# EasyEDA Pro project jackt-tong-yong-xiao-che-kong-zhi-qi-zhuan-li-948f377a.epro, board v5.2PCB
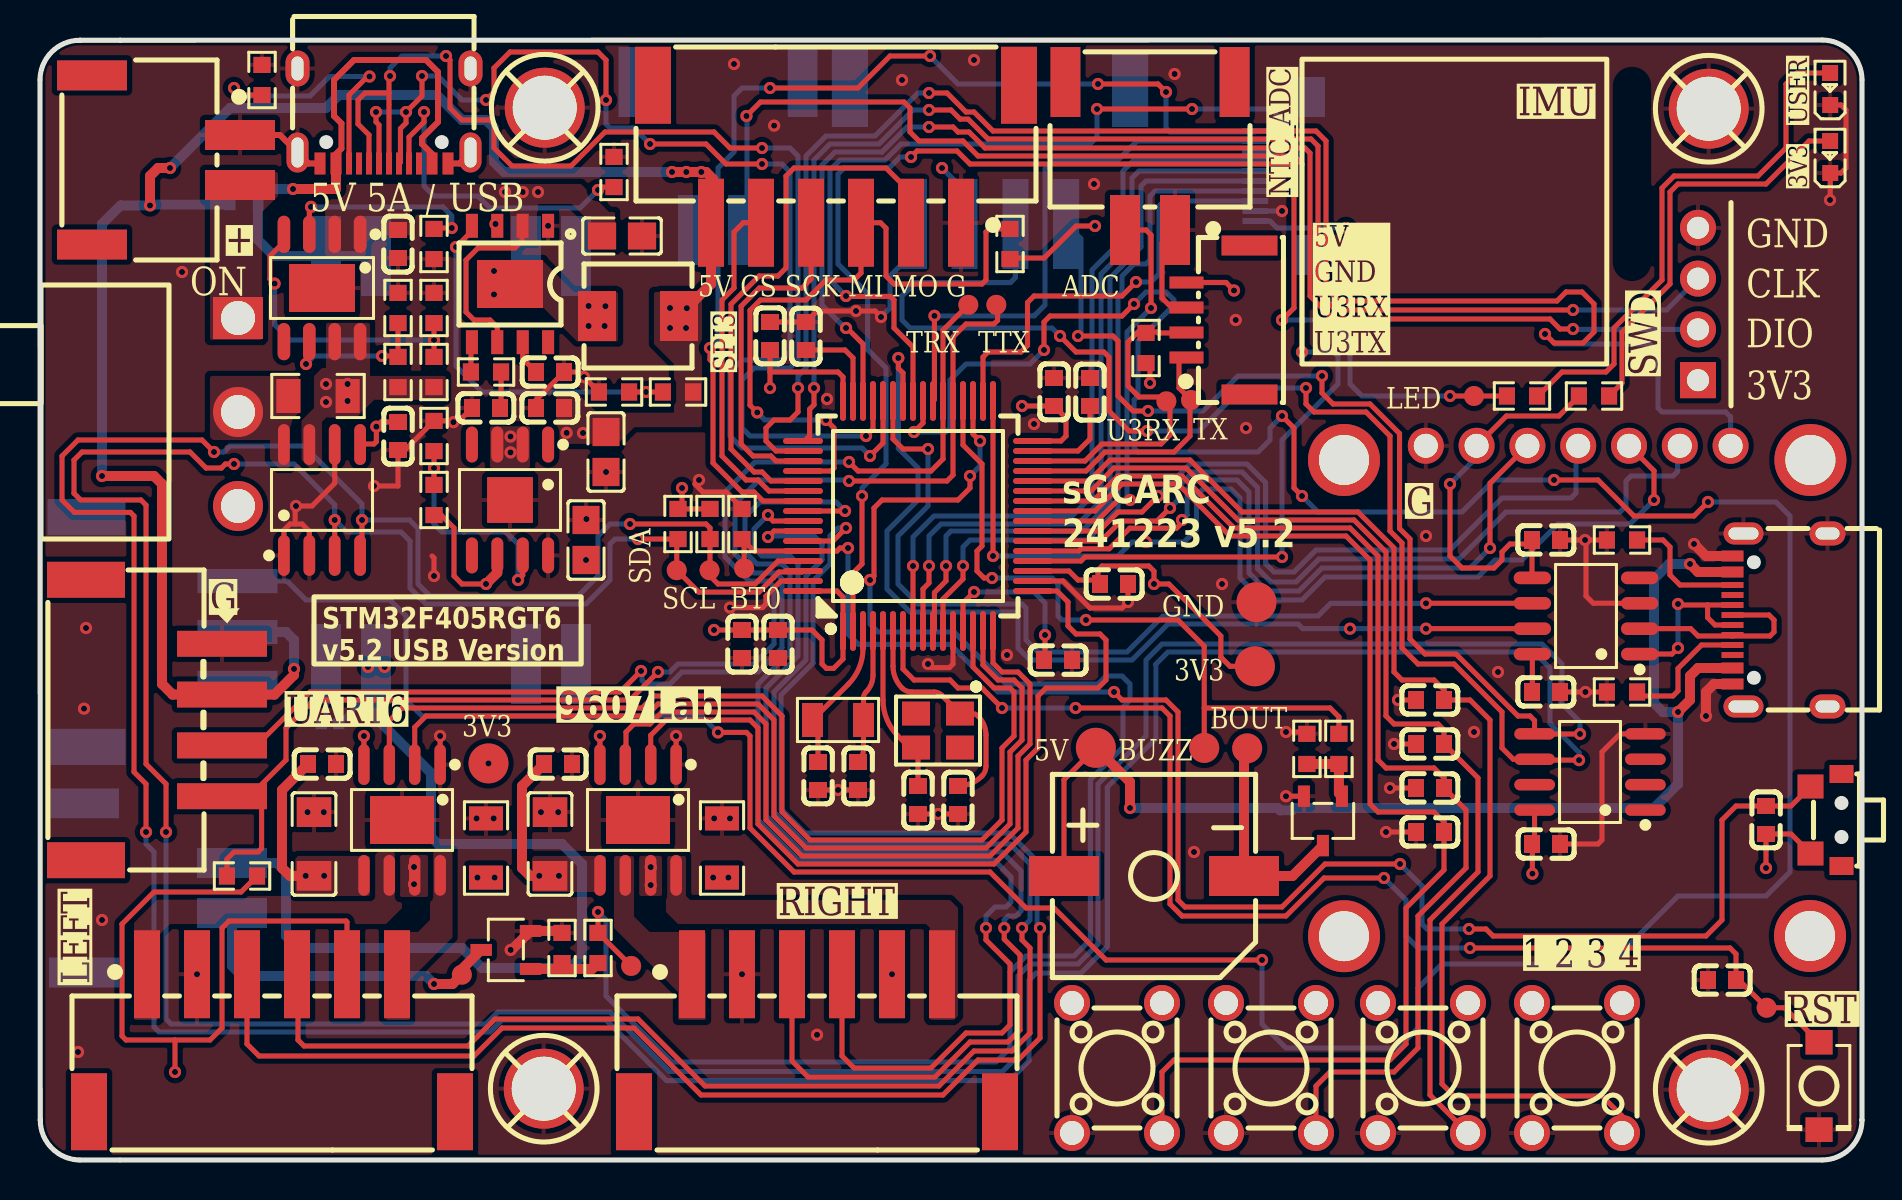
[diagram p6: board, top side]
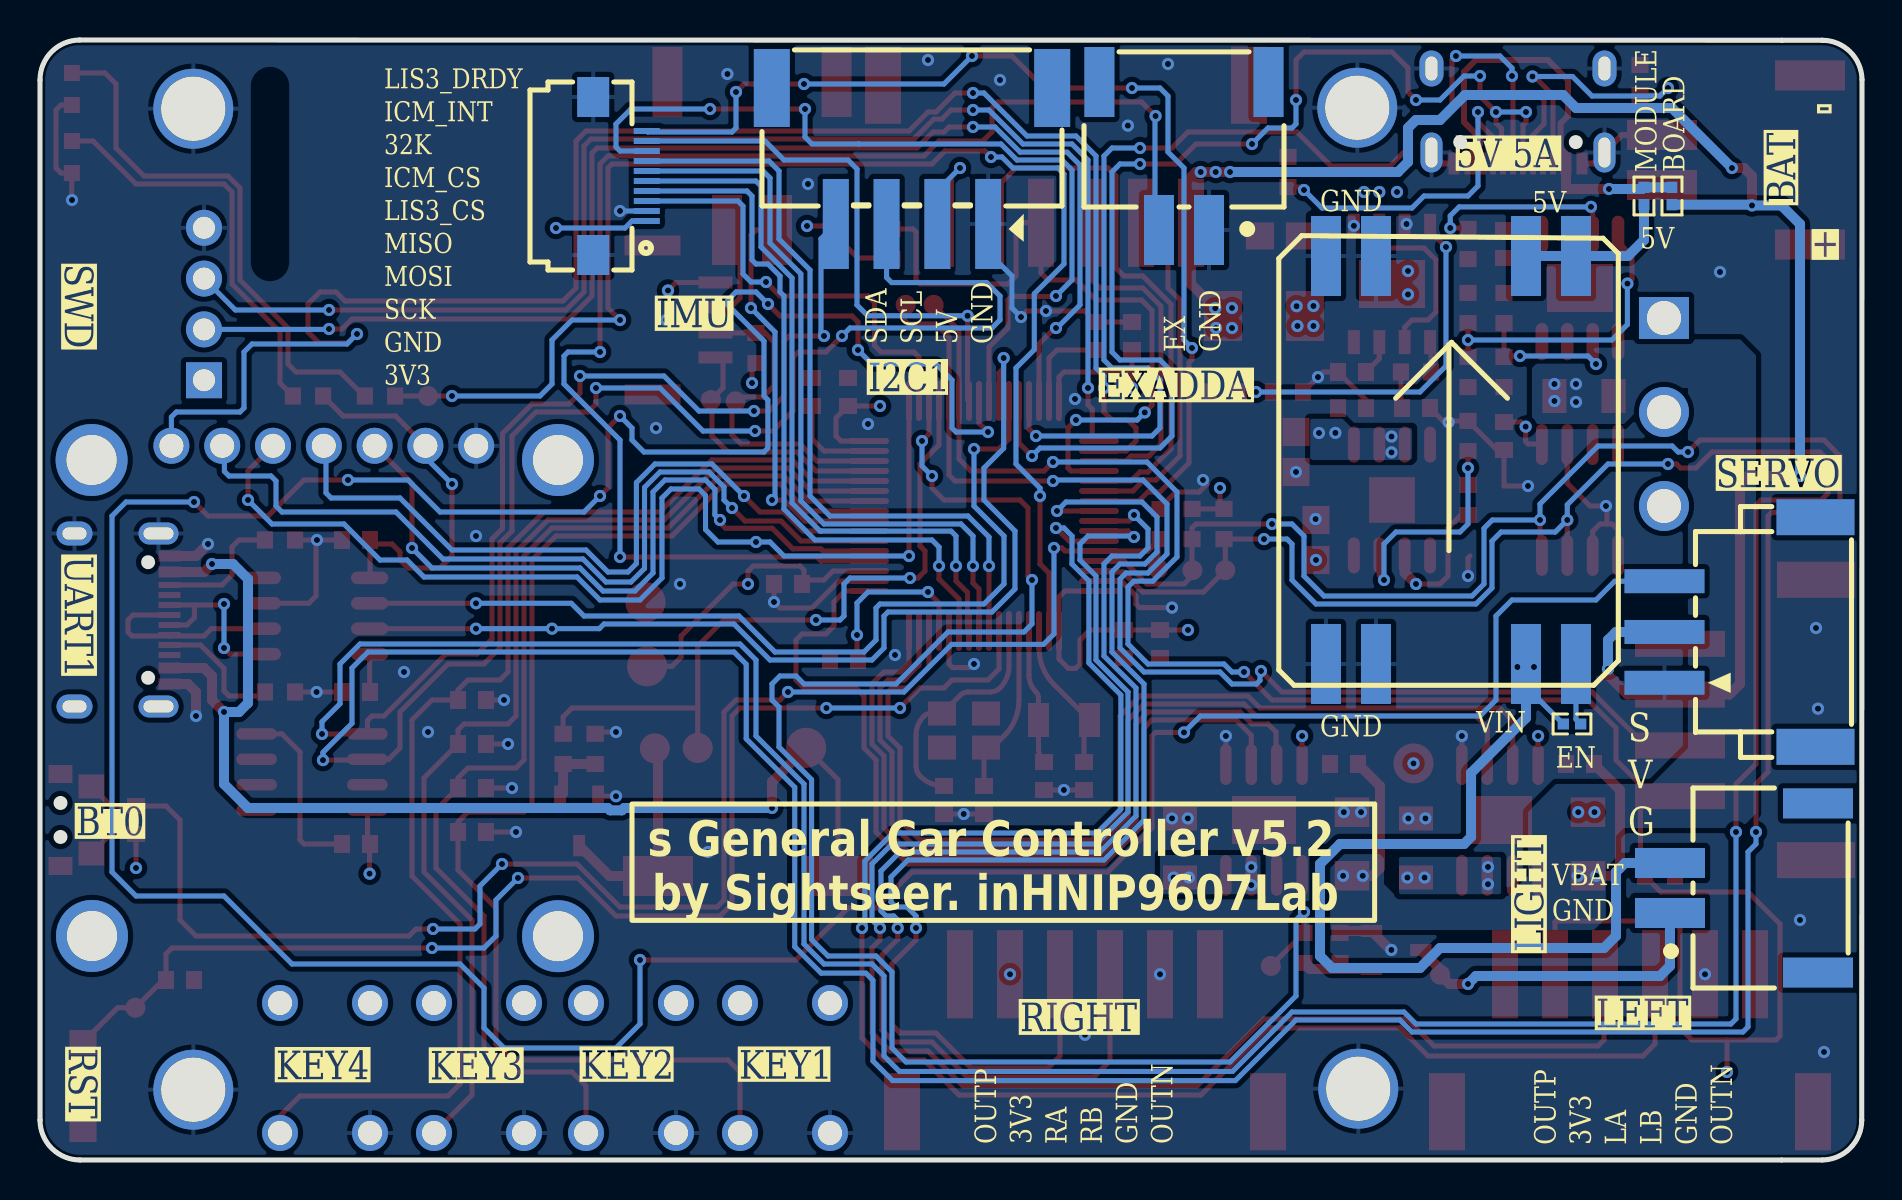
[diagram p7: board, bottom side, seen from below]

Outline 91.1 x 56 mm; copper layers: Top Layer, GND, VCC, Bottom Layer. Coordinates in mm from the lower left corner of the outline.
Outline path: 91.1,2 91.1,2 91.1,54 arc(90.52,55.41) 89.12,56 4,55.99 2,55.99 arc(0.59,55.41) 0,54.01 0.01,2 arc(0.59,0.59) 1.99,0 4.01,0 89.1,0 arc(90.51,0.58) 91.1,1.98
Stack: Top Layer 0.035mm 外层铜厚1oz / Dielectric1 0.2104mm 7628 RC49% 8.6mil / GND 0.0152mm 内层铜厚 / Dielectric2 1.065mm 1.1mm H/HOZ Copper / VCC 0.0152mm 内层铜厚 / Dielectric3 0.2104mm 7628 RC49% 8.6mil / Bottom Layer 0.035mm 外层铜厚1oz

## Design rules (mm)
spacing copperThickness1oz (default): track to track 0.102, other pairs 0.152 to 0.3
spacing copperThickness2oz: track to track 0.203, other pairs 0.152 to 0.3
spacing Plane_innerPlane: track to track 0.102, other pairs 0.152 to 0.3
spacing Copper_copperRegion: track to track 0.102, other pairs 0.152 to 0.3
spacing Copper_FULL: track to track 0.102, other pairs 0.152 to 0.3
track width copperThickness1oz (default): min 0.127, default 0.254, max 2.54
track width copperThickness2oz: min 0.203, default 0.254, max 2.54
differential pair differentialPair (default): width min 0.127, default 0.254, max 2.54; gap min 0.152, default 0.152
net 5V uses FULL
net VM uses FULL
net VBAT uses FULL
net $1N904 uses FULL
net ML_OUTN uses FULL
net ML_OUTP uses FULL
net MR_OUTN uses FULL
net MR_OUTP uses FULL
net $2N4785 uses FULL
net $1N1481 uses FULL
net $1N949 uses FULL
net $1N2370 uses FULL
net $1N2361 uses FULL
region e1 uses Copper_copperRegion, copperRegion_Copper_copperRegion
region e2 uses Copper_copperRegion, copperRegion_Copper_copperRegion
region e3 uses Copper_copperRegion, copperRegion_Copper_copperRegion
region e4 uses Copper_copperRegion, copperRegion_Copper_copperRegion
region e5 uses Copper_copperRegion, copperRegion_Copper_copperRegion
region e6 uses Copper_copperRegion, copperRegion_Copper_copperRegion
region e7 uses Copper_copperRegion, copperRegion_Copper_copperRegion
region e8 uses Copper_copperRegion, copperRegion_Copper_copperRegion
region e9 uses Copper_copperRegion, copperRegion_Copper_copperRegion
region e10 uses Copper_copperRegion, copperRegion_Copper_copperRegion
region e11 uses Copper_copperRegion, copperRegion_Copper_copperRegion
region e12 uses Copper_copperRegion, copperRegion_Copper_copperRegion
region e13 uses Copper_copperRegion, copperRegion_Copper_copperRegion
region e14 uses Copper_copperRegion, copperRegion_Copper_copperRegion
region e15 uses Copper_copperRegion, copperRegion_Copper_copperRegion
region e16 uses Copper_copperRegion, copperRegion_Copper_copperRegion
region e17 uses Copper_copperRegion, copperRegion_Copper_copperRegion
region e18 uses Copper_copperRegion, copperRegion_Copper_copperRegion
region e19 uses Copper_copperRegion, copperRegion_Copper_copperRegion
region e20 uses Copper_copperRegion, copperRegion_Copper_copperRegion
region e21 uses Copper_copperRegion, copperRegion_Copper_copperRegion
region e22 uses Copper_copperRegion, copperRegion_Copper_copperRegion
region e23 uses Copper_copperRegion, copperRegion_Copper_copperRegion
region e24 uses Copper_copperRegion, copperRegion_Copper_copperRegion
region e25 uses Copper_copperRegion, copperRegion_Copper_copperRegion
region e26 uses Copper_copperRegion, copperRegion_Copper_copperRegion
region e27 uses Copper_copperRegion, copperRegion_Copper_copperRegion
region e28 uses Copper_copperRegion, copperRegion_Copper_copperRegion
region e29 uses Copper_copperRegion, copperRegion_Copper_copperRegion
region e30 uses Copper_copperRegion, copperRegion_Copper_copperRegion
region e31 uses Copper_copperRegion, copperRegion_Copper_copperRegion
region e32 uses Copper_copperRegion, copperRegion_Copper_copperRegion
region e33 uses Copper_copperRegion, copperRegion_Copper_copperRegion
region e34 uses Copper_copperRegion, copperRegion_Copper_copperRegion
region e35 uses Copper_copperRegion, copperRegion_Copper_copperRegion
region e36 uses Copper_copperRegion, copperRegion_Copper_copperRegion
region e37 uses Copper_copperRegion, copperRegion_Copper_copperRegion
region e38 uses Copper_copperRegion, copperRegion_Copper_copperRegion
region e39 uses Copper_copperRegion, copperRegion_Copper_copperRegion
region e40 uses Copper_copperRegion, copperRegion_Copper_copperRegion
region e41 uses Copper_copperRegion, copperRegion_Copper_copperRegion
region e42 uses Copper_copperRegion, copperRegion_Copper_copperRegion
region e43 uses Copper_copperRegion, copperRegion_Copper_copperRegion
region e44 uses Copper_copperRegion, copperRegion_Copper_copperRegion
region e45 uses Copper_copperRegion, copperRegion_Copper_copperRegion
region e46 uses Copper_copperRegion, copperRegion_Copper_copperRegion
region e47 uses Copper_copperRegion, copperRegion_Copper_copperRegion
region e48 uses Copper_copperRegion, copperRegion_Copper_copperRegion
region e49 uses Copper_copperRegion, copperRegion_Copper_copperRegion
region e50 uses Copper_copperRegion, copperRegion_Copper_copperRegion
region e51 uses Copper_copperRegion, copperRegion_Copper_copperRegion
region e52 uses Copper_copperRegion, copperRegion_Copper_copperRegion
region e53 uses Copper_copperRegion, copperRegion_Copper_copperRegion
region e54 uses Copper_copperRegion, copperRegion_Copper_copperRegion
region e55 uses Copper_copperRegion, copperRegion_Copper_copperRegion
region e56 uses Copper_copperRegion, copperRegion_Copper_copperRegion
region e57 uses Copper_copperRegion, copperRegion_Copper_copperRegion
region e58 uses Copper_copperRegion, copperRegion_Copper_copperRegion
region e59 uses Copper_copperRegion, copperRegion_Copper_copperRegion
region e60 uses Copper_FULL, copperRegion_Copper_FULL
region e61 uses Copper_FULL, copperRegion_Copper_FULL
region e62 uses Copper_copperRegion, copperRegion_Copper_copperRegion
region e63 uses Copper_copperRegion, copperRegion_Copper_copperRegion
region e64 uses Copper_copperRegion, copperRegion_Copper_copperRegion
region e65 uses Copper_copperRegion, copperRegion_Copper_copperRegion
region e66 uses Copper_copperRegion, copperRegion_Copper_copperRegion
region e67 uses Copper_copperRegion, copperRegion_Copper_copperRegion
region e68 uses Copper_copperRegion, copperRegion_Copper_copperRegion
region e69 uses Copper_copperRegion, copperRegion_Copper_copperRegion
pour e2056 uses Copper_FULL, copperRegion_Copper_FULL
pour e2058 uses Copper_FULL, copperRegion_Copper_FULL
pour e2060 uses Copper_FULL, copperRegion_Copper_FULL
pour e2062 uses Copper_FULL, copperRegion_Copper_FULL
pour e2064 uses Copper_FULL, copperRegion_Copper_FULL
pour e2066 uses Copper_FULL, copperRegion_Copper_FULL
pour e2068 uses Copper_FULL, copperRegion_Copper_FULL
pour e2070 uses Copper_FULL, copperRegion_Copper_FULL
pour e2072 uses Copper_FULL, copperRegion_Copper_FULL
pour e2074 uses Copper_FULL, copperRegion_Copper_FULL
pour e2076 uses Copper_FULL, copperRegion_Copper_FULL
pour e2078 uses Copper_FULL, copperRegion_Copper_FULL
pour e2080 uses Copper_FULL, copperRegion_Copper_FULL
pour e2082 uses Copper_FULL, copperRegion_Copper_FULL
pour e2084 uses Copper_FULL, copperRegion_Copper_FULL
pour e2086 uses Copper_FULL, copperRegion_Copper_FULL
pour e2088 uses Copper_FULL, copperRegion_Copper_FULL
pour e2090 uses Copper_FULL, copperRegion_Copper_FULL
pour e2092 uses Copper_copperRegion, copperRegion_Copper_copperRegion
pour e2367 uses Copper_copperRegion, copperRegion_Copper_copperRegion
pour e2474 uses Copper_FULL, copperRegion_Copper_FULL

## Placement (name value [footprint] x y rotation side)
BUZZER1  2.7kHz  [BUZ-SMD_L9.6-W9.6-LS10.0-R]  55.7 14.2 180 top
C1  0.1uF  [C0603]  17.9 36.2 90 top
C3  0.1uF  [C0603]  17.9 45.8 90 top
C4  10uF  [C0805]  29.1 46.2 180 top
C6  16nF  [C0603]  22.3 37.6 0 top
C7  22nF  [C0603]  25.5 39.4 180 top
C8  0.1uF  [C0603]  25.5 37.6 0 top
C9  22uF  [C0805]  28.3 35.4 90 top
C10  0.1uF  [C0603]  14.1 19.8 180 top
C11  22uF  [C1206]  13.7 15.8 270 top
C12  22uF  [C0805]  27.3 31 270 top
C13  0.1uF  [C0603]  25.9 19.8 180 top
C14  22uF  [C1206]  25.5 15.8 270 top
C16  0.1uF  [C0603]  75.3 23.4 0 top
C17  0.1uF  [C0603]  75.3 31 0 top
C20  0.1uF  [C0603]  75.3 15.8 180 top
C21  0.1uF  [C0603]  50.9 25 180 top
C22  0.1uF  [C0603]  53.7 28.8 180 top
C23  0.1uF  [C0603]  36.5 41.2 270 top
C24  0.1uF  [C0603]  36.9 25.8 90 top
C25  0.1uF  [C0603]  50.7 38.4 270 top
C26  0.1uF  [C0603]  69.5 16.4 0 top
C27  0.1uF  [C0603]  69.5 18.6 0 top
C28  0.1uF  [C0603]  69.5 20.8 0 top
C29  0.1uF  [C0603]  69.5 23 0 top
C30  0.1uF  [C0603]  86.3 17 270 top
C31  2.2uF  [C0603]  52.5 38.4 90 top
C32  1uF  [C0603]  35.1 25.8 90 top
C33  2.2uF  [C0603]  38.3 41.2 90 top
C34  0.1uF  [C0603]  84.1 9 180 top
C35  22pF  [C0603]  43.9 18 90 top
C36  22pF  [C0603]  38.9 19.2 270 top
C37  22pF  [C0603]  45.9 18 90 top
C38  22pF  [C0603]  40.9 19.2 270 top
CN1  ZX-XH2.54-2PWT  [CONN-SMD_2P-P2.54_MEGASTAR_ZX-XH2.54-2PWT]  6.3 50 270 top
CN2  HCZZ0021-6  [CONN-SMD_HCZZ0021-6]  11.6 5.85 0 top
CN3  HCZZ0021-6  [CONN-SMD_HCZZ0021-6]  38.85 5.85 0 top
CN5  ZX-XH2.54-2PWT  [CONN-SMD_2P-P2.54_MEGASTAR_ZX-XH2.54-2PWT]  5.9 13.6 90 bottom
CN6  HCZZ0021-6  [CONN-SMD_HCZZ0021-6]  39.8 50.3 180 top
CN7  XDWF-2500-04P  [CONN-SMD_4P-P2.54_MXXH-2.54-04P-WT1-0-A]  5.7 22 270 top
CN9  ZX-XH2.54-2PWT  [CONN-SMD_2P-P2.54_MEGASTAR_ZX-XH2.54-2PWT]  55.5 50.2 180 top
CN10  ZX-XH2.54-2PWT  [CONN-SMD_2P-P2.54_MEGASTAR_ZX-XH2.54-2PWT]  33.9 50.2 0 bottom
CN11  XDWF-2500-04P  [CONN-SMD_4P-P2.54_MXXH-2.54-04P-WT1-0-A]  47.5 50.2 0 bottom
CN12  ZX-XH2.54-3PWT  [CONN-SMD_3P-P2.54-XH2.54-WT]  6.1 26.4 90 bottom
CRYSTAL1  8MHz  [CRYSTAL-SMD_4P-L3.2-W2.5-BL_SIT8008BI]  44.9 21.47 180 top
FPC1  AFC01-S10FCA-00  [FPC-SMD_P0.5-10P_FGS-XJ-H2.0]  62.1 49.2 90 bottom
H3  PZ254R-11-04P  [HDR-TH_4P-P2.54-H-M-W10.4]  82.9 42.8 90 top
L1  4.7uH  [IND-SMD_L5.4-W5.2_FXL0530]  29.9 42.2 0 top
LED1  -  [LED_0603]  89.5 50.2 90 top
LED2  -  [LED_0603]  89.5 53.6 90 top
Q1  AO3400A  [SOT-23-3_L2.9-W1.6-P1.90-LS2.8-BR]  23.29 10.5 0 top
Q2  AO3400A  [SOT-23-3_L2.9-W1.6-P1.90-LS2.8-BR]  64.15 16.96 90 top
R1  50mR  [R1206]  13.9 38.2 0 top
R2  52.5K  [R0603]  31.9 38.4 0 top
R3  1.4K  [R0603]  22.3 39.4 180 top
R4  10K  [R0603]  28.7 38.4 0 top
R5  22K  [R0603]  19.7 33 270 top
R6  100mR  [R1206]  22.3 15.6 90 top
R7  3.92K  [R0603]  19.7 36.2 270 top
R8  100mR  [R1206]  34.1 15.6 90 top
R9  0  [R0402]  14.5 21.8 180 bottom
R12  5.1K  [R0603]  79.1 31 0 top
R17  5.1K  [R0603]  79.1 23.4 0 top
R18  510R  [R0603]  27.9 10.6 270 top
R19  100K  [R0603]  26.1 10.6 270 top
R20  4.7K  [R0603]  48.5 45.8 270 top
R21  4.7K  [R0603]  10.1 14.2 0 top
R22  2.2K  [R0603]  31.9 31.8 90 top
R23  2.2K  [R0603]  33.5 31.8 90 top
R24  220R  [R0603]  64.95 20.56 270 top
R25  100K  [R0603]  63.35 20.56 270 top
R26  470R  [R0603]  77.7 38.2 180 top
R27  220R  [R0603]  74.1 38.2 180 top
R28  10K  [R0603]  35.1 31.8 270 top
R29  150K  [R0603]  19.7 39.4 90 top
R30  10K  [R0603]  19.7 42.6 90 top
R31  4.7K  [R0603]  19.7 45.8 90 top
R32  47K  [R0603]  17.9 39.4 270 top
R33  10K  [R0603]  17.9 42.6 270 top
R35  4.7K  [R0603]  55.3 40.6 90 top
R36  NC  [R0402]  10.9 48.2 90 bottom
R37  NC  [R0402]  9.5 48.2 90 bottom
R38  5.1K  [R0603]  11.1 54 270 top
R39  5.1K  [R0603]  28.7 49.4 270 top
SCREW1  -  [M3螺丝]  25.3 52.55 0 top
SCREW2  -  [M3螺丝]  83.5 52.5 0 top
SCREW3  -  [M3螺丝]  25.25 3.5 0 top
SCREW4  -  [M3螺丝]  83.5 3.45 0 top
SW1  -  [SW-TH_4P-L6.0-W6.0-P4.50-LS6.5]  53.85 4.6 90 top
SW2  -  [SW-TH_4P-L6.0-W6.0-P4.50-LS6.5]  61.55 4.6 90 top
SW3  -  [SW-TH_4P-L6.0-W6.0-P4.50-LS6.5]  69.15 4.6 90 top
SW4  -  [SW-TH_4P-L6.0-W6.0-P4.50-LS6.5]  76.85 4.6 90 top
SW5  TS24CA  [SW-SMD_TS24CA]  89.3 17 270 top
SW6  TS-1088-AR02016  [SW-SMD_L3.9-W3.0-P4.45]  88.95 3.7 270 top
TP1  -  [Test-Point-0.5mm]  52.79 20.61 0 top
TP2  -  [Test-Point-0.5mm]  60.75 24.69 0 top
TP5  -  [Test-Point-0.5mm#2]  57.55 38 0 top
TP6  -  [Test-Point-0.5mm#2]  56.32 37.94 0 top
TP7  -  [Test-Point-0.5mm#2]  21.09 9.27 0 top
TP8  -  [Test-Point-0.5mm#2]  29.56 9.7 0 top
TP10  -  [Test-Point-0.5mm#2]  46.42 42.76 0 top
TP11  -  [Test-Point-0.5mm#2]  47.82 42.76 0 top
TP13  -  [Test-Point-0.5mm#3]  60.36 20.58 0 top
TP14  -  [Test-Point-0.5mm#3]  58.21 20.6 0 top
TP15  -  [Test-Point-0.5mm#2]  31.84 29.49 0 top
TP16  -  [Test-Point-0.5mm#2]  33.48 29.49 0 top
TP17  -  [Test-Point-0.5mm]  22.42 19.83 0 top
TP19  -  [Test-Point-0.5mm#2]  71.7 38.2 0 top
TP20  -  [Test-Point-0.5mm]  60.82 27.89 0 top
TP21  -  [Test-Point-0.5mm#2]  35.21 29.58 0 top
TP22  -  [Test-Point-0.5mm#2]  86.33 7.61 0 top
U1  SS-12D06-G050  [SW-TH_3P-P4.70_SS-12D06-G050]  9.9 37.4 270 top
U2  INA219AID  [SOIC-8_L4.9-W3.9-P1.27-LS6.0-BL]  14.1 33 0 top
U3  MX25947ES  [ESOP-8_L4.9-W3.9-P1.27-LS6.0-BL-EP-1]  14.1 43.6 180 top
U4  ME3118ASPG  [ESOP-8_L4.9-W3.9-P1.27-LS6.0-BL-EP]  23.5 43.8 180 top
U5  RT2515HGSP  [SOP-8_L4.9-W3.9-P1.27-LS6.0-BL-EP]  23.5 33 180 top
U6  DRV8870DDAR  [HSOP-8_L5.0-W4.0-P1.27-LS6.2-BL-EP]  18.1 17 180 top
U7  DRV8870DDAR  [HSOP-8_L5.0-W4.0-P1.27-LS6.2-BL-EP]  29.9 17 180 top
U8  XN-50L  [小聂studio-5V稳压]  14.3 45.2 270 bottom
U9  CH340N  [SOP-8_L4.9-W3.9-P1.27-LS6.0-BL]  77.3 27.2 90 top
U11  WAFER-GH1.25-4PWB  [CONN-SMD_4P-P1.25_XUNPU_WAFER-GH1.25-4PWB]  58.9 42 90 top
U13  -  [0.96寸7针OLED]  63.2 9 0 top
U14  STM32F405RGT6  [LQFP-64_L10.0-W10.0-P0.50-LS12.0-BL]  43.9 32.2 0 top
U15  MB85RC64TAPNF-G-BDERE1  [SOP-8_L5.0-W4.0-P1.27-LS6.0-BL]  77.5 19.4 90 top
USB1  TYPE-C 16PIN 2MD(073)  [USB-C-SMD_TYPE-C-6PIN-2MD-073]  87 27 90 top
USB2  TYPE-C 16PIN 2MD(073)  [USB-C-SMD_TYPE-C-6PIN-2MD-073]  17.2 52.2 180 top
X1  32.768kHz  [OSC-SMD_L3.2-W1.5]  39.9 22 180 top

## Footprints (pads in the part's own frame, mm; a bottom-side part is the same pattern mirrored in y, then rotated)
0.96寸7针OLED
  round 3.6 hole 2.5: 0(2,26) 0(2,2.19) 0(25.3,2.2) 0(25.32,26)
  round 1.8 hole 1.2: 1(6.09,26.71) 2(8.63,26.71) 3(11.17,26.71) 4(13.71,26.71) 5(16.25,26.71) 6(18.79,26.71) 7(21.33,26.71)
BUZ-SMD_L9.6-W9.6-LS10.0-R
  rect 3.5x2 smd: 1(4.5,0) 2(-4.5,0)
C0603
  rect 0.8x0.9 smd: 1(-0.7,0) 2(0.7,0)
C0805
  rect 1.41x1.35 smd: 1(-1,0) 2(1,0)
C1206
  rect 1.485x1.728 smd: 1(-1.593,0) 2(1.593,0)
CONN-SMD_2P-P2.54_MEGASTAR_ZX-XH2.54-2PWT
  rect 1.5x3.5 smd: 1(-1.25,3.7) 2(1.25,3.7) 3(-4.23,-3.7) 4(4.23,-3.7)
CONN-SMD_3P-P2.54-XH2.54-WT
  rect 1.2x4 smd: 1(-2.54,3.775) 2(0,3.775) 3(2.54,3.775)
  rect 1.8x3.9 smd: 4(-5.74,-3.775) 5(5.74,-3.775)
CONN-SMD_4P-P1.25_XUNPU_WAFER-GH1.25-4PWB
  rect 0.6x1.7 smd: 1(-1.875,1.575) 2(-0.625,1.575) 3(0.625,1.575) 4(1.875,1.575)
  rect 1x2.8 smd: 5(3.725,-1.575) 6(-3.725,-1.575)
CONN-SMD_4P-P2.54_MXXH-2.54-04P-WT1-0-A
  rect 1.3x4.5 smd: 1(-3.809,3.4) 2(-1.27,3.4) 3(1.27,3.4) 4(3.81,3.4)
  rect 1.8x3.9 smd: 5(7.01,-3.4) 6(-7.01,-3.4)
CONN-SMD_HCZZ0021-6
  rect 1.3x4.4 smd: 1(-6.25,3.438) 2(-3.75,3.438) 3(-1.25,3.438) 4(1.25,3.438) 5(3.75,3.438) 6(6.25,3.438)
  rect 1.8x3.85 smd: 7(-9.15,-3.438) 8(9.15,-3.438)
CRYSTAL-SMD_4P-L3.2-W2.5-BL_SIT8008BI
  rect 1.4x1.2 smd: 1(-1.1,-0.85) 2(1.1,-0.85) 3(1.1,0.85) 4(-1.1,0.85)
ESOP-8_L4.9-W3.9-P1.27-LS6.0-BL-EP
  rect 0.6x1.2 smd: 1(-1.905,-2.909) 2(-0.635,-2.909) 3(0.635,-2.909) 4(1.905,-2.909) 5(1.905,2.909) 6(0.635,2.909) 7(-0.635,2.909) 8(-1.905,2.909)
  rect 3.3x2.4 smd: 9(0,0)
ESOP-8_L4.9-W3.9-P1.27-LS6.0-BL-EP-1
  oval 0.63x1.865 smd: 1(-1.905,-2.683) 2(-0.635,-2.683) 3(0.635,-2.683) 4(1.905,-2.683) 5(1.905,2.683) 6(0.635,2.683) 7(-0.635,2.683) 8(-1.905,2.683)
  rect 3.3x2.4 smd: 9(0,0)
FPC-SMD_P0.5-10P_FGS-XJ-H2.0
  rect 0.3x1.3 smd: 1(-2.25,-1.339) 2(-1.75,-1.339) 3(-1.25,-1.34) 4(-0.75,-1.339) 5(-0.25,-1.34) 6(0.25,-1.339) 7(0.75,-1.339) 8(1.25,-1.339) 9(1.75,-1.339) 10(2.25,-1.34)
  rect 2x1.6 smd: 11(3.95,1.34) 12(-3.95,1.34)
HDR-TH_4P-P2.54-H-M-W10.4
  rect 1.8x1.8 hole 1.1: 1(-3.81,0)
  round 1.8 hole 1.1: 2(-1.27,0) 3(1.27,0) 4(3.81,0)
HSOP-8_L5.0-W4.0-P1.27-LS6.2-BL-EP
  oval 0.574x2.038 smd: 1(-1.905,-2.769) 2(-0.635,-2.769) 3(0.635,-2.769) 4(1.905,-2.769) 5(1.905,2.769) 6(0.635,2.769) 7(-0.635,2.769) 8(-1.905,2.769)
  rect 3.2x2.4 smd: 9(0,0)
IND-SMD_L5.4-W5.2_FXL0530
  rect 1.9x2.5 smd: 1(-2.05,0) 2(2.05,0)
LED_0603
  rect 0.8x0.8 smd: 1(-0.851,-0.01) 2(0.75,-0.005)
LQFP-64_L10.0-W10.0-P0.50-LS12.0-BL
  oval 0.3x2 smd: 1(-3.75,-5.75) 2(-3.25,-5.75) 3(-2.75,-5.75) 4(-2.25,-5.75) 5(-1.75,-5.75) 6(-1.25,-5.75) 7(-0.75,-5.75) 8(-0.25,-5.75) 9(0.25,-5.75) 10(0.75,-5.75) 11(1.25,-5.75) 12(1.75,-5.75) 13(2.25,-5.75) 14(2.75,-5.75) 15(3.25,-5.75) 16(3.75,-5.75) 33(3.75,5.75) 34(3.25,5.75) 35(2.75,5.75) 36(2.25,5.75) 37(1.75,5.75) 38(1.25,5.75) 39(0.75,5.75) 40(0.25,5.75) 41(-0.25,5.75) 42(-0.75,5.75) 43(-1.25,5.75) 44(-1.75,5.75) 45(-2.25,5.75) 46(-2.75,5.75) 47(-3.25,5.75) 48(-3.75,5.75)
  oval 2x0.3 smd: 17(5.75,-3.75) 18(5.75,-3.25) 19(5.75,-2.75) 20(5.75,-2.25) 21(5.75,-1.75) 22(5.75,-1.25) 23(5.75,-0.75) 24(5.75,-0.25) 25(5.75,0.25) 26(5.75,0.75) 27(5.75,1.25) 28(5.75,1.75) 29(5.75,2.25) 30(5.75,2.75) 31(5.75,3.25) 32(5.75,3.75) 49(-5.75,3.75) 50(-5.75,3.25) 51(-5.75,2.75) 52(-5.75,2.25) 53(-5.75,1.75) 54(-5.75,1.25) 55(-5.75,0.75) 56(-5.75,0.25) 57(-5.75,-0.25) 58(-5.75,-0.75) 59(-5.75,-1.25) 60(-5.75,-1.75) 61(-5.75,-2.25) 62(-5.75,-2.75) 63(-5.75,-3.25) 64(-5.75,-3.75)
M3螺丝
  round 4 hole 3.2: 1(-0.064,0.064)
OSC-SMD_L3.2-W1.5
  rect 1.05x1.7 smd: 1(-1.275,0) 2(1.275,0)
R0402
  rect 0.566x0.54 smd: 1(-0.433,0) 2(0.433,0)
R0603
  rect 0.806x0.864 smd: 1(-0.753,0) 2(0.753,0)
R1206
  rect 1.208x1.701 smd: 1(-1.479,0) 2(1.479,0)
SOIC-8_L4.9-W3.9-P1.27-LS6.0-BL
  oval 0.588x2.045 smd: 1(-1.905,-2.772) 2(-0.635,-2.772) 3(0.635,-2.772) 4(1.905,-2.772) 5(1.905,2.772) 6(0.635,2.772) 7(-0.635,2.772) 8(-1.905,2.772)
SOP-8_L4.9-W3.9-P1.27-LS6.0-BL
  oval 0.63x1.865 smd: 1(-1.905,-2.683) 2(-0.635,-2.683) 3(0.635,-2.683) 4(1.905,-2.683) 5(1.905,2.683) 6(0.635,2.683) 7(-0.635,2.683) 8(-1.905,2.683)
SOP-8_L4.9-W3.9-P1.27-LS6.0-BL-EP
  oval 0.6x1.8 smd: 1(-1.905,-2.772) 2(-0.635,-2.772) 3(0.635,-2.772) 4(1.905,-2.772) 5(1.905,2.772) 6(0.635,2.772) 7(-0.635,2.772) 8(-1.905,2.772)
  rect 2.29x2.29 smd: 9(0,0)
SOP-8_L5.0-W4.0-P1.27-LS6.0-BL
  oval 0.574x2.035 smd: 1(-1.905,-2.768) 2(-0.635,-2.768) 3(0.635,-2.768) 4(1.905,-2.768) 5(1.905,2.768) 6(0.635,2.768) 7(-0.635,2.768) 8(-1.905,2.768)
SOT-23-3_L2.9-W1.6-P1.90-LS2.8-BR
  rect 1.07x0.6 smd: 1(1.235,-0.95) 2(1.235,0.95) 3(-1.235,0)
SW-SMD_L3.9-W3.0-P4.45
  rect 1.23x1.36 smd: 1(-2.185,0) 2(2.185,0)
SW-SMD_TS24CA
  rect 0.9x1.2 smd: 1(-2.3,0.775) 2(2.3,0.775)
  rect 1.2x1.3 smd: 3(-1.675,-0.775) 4(1.675,-0.775)
SW-TH_3P-P4.70_SS-12D06-G050
  rect 2.1x2.5 hole 1.7: 1(-4.7,0)
  round 2.5 hole 1.7: 2(0,0) 3(4.7,0)
SW-TH_4P-L6.0-W6.0-P4.50-LS6.5
  round 1.8 hole 1.2: 1(-3.25,2.25) 2(3.25,2.25) 3(-3.25,-2.25) 4(3.25,-2.25)
Test-Point-0.5mm
  round 2 smd: 1(0,0)
Test-Point-0.5mm#2
  round 1 smd: 1(0,0)
Test-Point-0.5mm#3
  round 1.5 smd: 1(0,0)
USB-C-SMD_TYPE-C-6PIN-2MD-073
  rect 0.55x1.1 smd: 1(-3.2,2.375) 2(-2.4,2.375) 11(2.4,2.375) 12(3.2,2.375)
  rect 0.3x1.1 smd: 3(-1.75,2.375) 4(-1.25,2.375) 5(-0.75,2.375) 6(-0.25,2.375) 7(0.25,2.375) 8(0.75,2.375) 9(1.25,2.375) 10(1.75,2.375)
  oval 1.1x2 hole 0.6x1.5: 13(-4.325,1.825) 14(4.325,1.825)
  oval 1.2x1.8 hole 0.6x1.2: 13(-4.325,-2.375) 14(4.325,-2.375)
小聂studio-5V稳压
  rect 4x1.5 smd: 1(0,0) 2(0,-2.5) 3(0,-10) 4(0,-12.5) 5(20.4,-12.5) 6(20.4,-10) 7(20.4,-2.5) 8(20.4,0)

## Nets
As in the schematic.

Pads without a net: CN1 3 4; CN2 7 8; CN3 7 8; CN5 3 4; CN6 7 8; CN7 5 6; CN9 3 4; CN10 3 4; CN11 5 6; CN12 4 5; CRYSTAL1 2 4; SW1 2 4; SW2 2 4; SW3 2 4; SW4 2 4; SW5 1 2; U1 3; U3 5; U4 8; U5 1 4 5; U9 4; U11 5 6; U13 0; U15 1 2 3 7; USB1 3 9 13; USB2 3 9

## Via types
v1: diameter 0.61, hole 0.305, Top Layer to Bottom Layer, 259 vias

## Routing (per net, layer and track width the routed paths; a pad name or vN(x,y) marks a point on that pad's centre or on a via; arc(x,y) is an arc through that point)
3V3: length 136.6
  Top Layer w0.254: v1(70.5,33.8) 70.5,30.2 71.1,29.6 72.7,29.6 73.1,30 73.1,30.4 73.5,30.8 74.4,30.8 C17.1 74.6,29.12 U9.5 ; U14.32 51.05,35.95 51.3,36.2 51.3,37.1 C25.2 v1(49.1,37.7) ; 6.75,6 4.3,6 4.1,6.2 4.1,11.8 5.7,13.4 10.05,13.4 R21.2 ; 6.75,6 8.5,6 9.1,6.6 9.1,11.6 9.45,11.95 15.3,11.95 15.35,11.9 CN2.5 ; 6.75,6 v1(6.75,4.4) ; U6.4 v1(16.2,21.2) ; v1(50.25,26.25) 50.25,25.05 C21.2 ; R5.2 20.05,32.25 20.7,31.6 20.7,29.2 21.1,28.8 v1(22.3,28.8) ; U14.64 39.85,28.45 40.15,28.15 U14.1 40.15,25.05 39.68,24.58 39.32,24.58 39.1,24.8 39.1,26 38.6,26.5 C24.2 C32.2 v1(33.7,26.5) ; 36.5,39.4 39.9,39.4 40.15,39.15 U14.48 ; 36.5,39.4 v1(36.5,38.6) ; 36.5,39.4 C23.2 ; U14.13 46.15,27.85 v1(46.7,28.4) ; C1.2 17.05,36.9 v1(16.82,36.67) 16.82,35.92 16.7,35.8 16.03,35.8 U2.5 ; 55.45,39.85 55.5,39.8 v1(55.5,38.85) ; 52.9,28.9 52.8,29 51.9,29 51.45,29.45 U14.19 ; 52.9,28.9 52.9,29.5 53.1,29.7 55.44,29.7 55.7,29.44 v1(55.7,28.8) 56.44,28.8 59.04,26.2 59.04,25.14 59.5,24.69 TP2.1 ; 52.9,28.9 C22.2 ; v1(32.1,33.6) 32.1,32.75 R22.2 R23.2 ; U7.4 v1(28,21.2) ; R20.2 48.55,45.1 50.2,45.1 51.81,46.7 v1(52.75,46.7) ; 74.73,17.5 74.73,15.93 C20.2 74.62,15.78 v1(74.62,14.32) ; SW5.4 87.55,16.3 C30.2 v1(86.3,14.6) ; R26.2 75.95,37.2 73.32,37.2 U13.2
  Top Layer w0.5: v1(22.3,28.8) 22.87,29.37 U5.6
  Bottom Layer w0.254: U13.2 71.83,35.13 v1(70.5,33.8) ; FPC1.1 61.5,46.95 61.85,46.6 v1(65.3,46.6) ; v1(50.25,26.25) 50.25,27.85 49.7,28.4 v1(46.7,28.4)
  vias: v1(22.42,19.83) v1(27.3,30) v1(42.6,9.29)
5V: length 150.2
  Top Layer w0.254: TP1.1 51.2,19.02 BUZZER1.1 ; v1(59.7,43.48) 59.3,43.88 57.73,43.88
  Top Layer w0.5: v1(6.5,49.6) 5.9,49.6 5.5,49.2 v1(5.5,47.73) ; TP1.1 54.5,18.9 v1(54.5,17.6) ; v1(82.5,29.8) 82.9,29.4 USB1.11 ; L1.2 v1(32.34,42.59) 33.55,43.8 CN6.6 33.65,46.97 33.65,49.05 33.3,49.4 v1(32.32,49.4) v1(31.6,49.4) ; v1(3.1,34.2) 5.7,34.2 6.1,33.8 6.1,23.8 6.63,23.27 CN7.2 11.72,23.27 12.7,24.25 v1(12.7,24.56) ; v1(81.9,22.4) 82.5,23 82.5,24.2 82.9,24.6 USB1.2
  Bottom Layer w0.254: CN11.2 46.23,48.47 v1(45.1,49.6)
  Bottom Layer w0.5: v1(12.7,24.56) 12.7,26 12.3,26.4 CN12.2 ; R37.1 5.5,47.77 ; v1(6.5,49.6) 9.5,52.6 14.3,52.6 14.95,53.25 19.85,53.25 21.1,52 22.3,52 22.7,51.6 22.7,49.9 23.2,49.4 v1(31.6,49.4) ; v1(82.5,29.8) 81.45,29.8 80.7,29.05 80.7,22.85 81.15,22.4 v1(81.9,22.4) 81.9,18.8 80.7,17.6 62.71,17.6 62.59,17.48 62.01,17.48 61.89,17.6 v1(54.5,17.6) ; v1(5.5,47.73) 4.03,47.73 3.1,46.8 v1(3.1,34.2)
  vias: v1(23.53,36.17) v1(23.53,35.38) v1(26.33,36.36) v1(27.15,36.35) v1(31.5,42.6) v1(31.5,41.6) v1(32.3,41.6) v1(33.07,49.4)
GND: length 110.5
  Top Layer w0.254: U2.2 13.47,31.44 13.1,31.8 12.75,31.8 ; U2.6 14.74,33.84 13.6,32.7 v1(12.8,32.7) 12.75,32.65 12.75,31.8 ; U2.1 12.2,31.5 12.5,31.8 12.75,31.8 ; C22.1 v1(54.4,27.9) 54.1,27.6 52.5,27.6 51.15,28.95 U14.18 ; C6.1 20.95,36.95 R7.1 18.25,35.5 C1.1 17.9,33.7 v1(16.7,33.7) ; C36.2 v1(39.91,18.5) C38.2 ; C17.2 v1(77.25,31) ; v1(77.25,31) 77.3,30.95 77.3,28.2 77.67,27.84 U9.3 ; v1(77.25,31) R12.1 ; v1(89.5,48) 89.51,48.01 LED1.1 90.05,49.35 90.3,49.6 90.3,52.5 90.05,52.75 LED2.1 ; v1(44.4,24.8) 44.58,24.62 45.47,24.62 45.65,24.8 U14.12 ; v1(34.5,27.62) 36.12,27.62 36.3,27.8 36.3,28.2 37.05,28.95 U14.63 ; C16.2 v1(77.27,23.4) R17.1 ; C23.1 C33.2 38.85,42.45 v1(40.8,42.45) 41.75,42.45 v1(42.05,42.15) ; C8.1 24.8,38 C7.1 26.95,39.4 v1(27.2,39.15) R4.1 ; v1(62.3,21.4) 63.25,21.4 R25.1 ; C27.1 v1(67.5,18.6) ; C20.1 77.9,15.8 78.1,16 78.1,20.4 79.01,21.31 80.27,21.31 ; C29.1 v1(67.9,23) ; 19.6,30.2 19.7,30.1 v1(19.7,29.2) ; v1(32.95,34) 32.76,33.81 32.76,33.79 33.14,33.4 34.3,33.4 35.1,32.6 R28.1 ; U6.1 v1(20.01,21.2) ; CN9.1 56.1,45.85 56.1,43.1 56.58,42.63 57.73,42.63 ; U7.1 v1(31.81,21.2) ; Q2.2 v1(62.3,18.19) ; C35.1 v1(44.91,17.3) C37.1 ; C28.1 v1(67.7,20.8) ; C26.1 v1(67.3,16.4)
  Top Layer w0.3: USB2.12 13.43,49.83 USB2.14 12,51.25 CN1.1 ; USB2.1 20.98,49.83 USB2.13
  Top Layer w0.5: R19.1 26,11.45 Q1.2 23.58,10.5 v1(23.53,10.5) ; USB1.12 83.3,30.2 v1(82.7,30.8) ; v1(83.3,22.2) 83.3,23.4 83.7,23.8 USB1.1
  Bottom Layer w0.254: v1(42.05,42.15) 42.5,42.6 42.5,44.2 43.69,45.39 CN11.1 ; FPC1.2 v1(62.1,47.45)
  vias: v1(1.9,5.4) v1(2.2,22.57) v1(2.3,26.6) v1(3.1,12) v1(7.1,44.4) v1(7.85,9.29) v1(13.38,17.39) v1(14.19,17.39) v1(20.67,36.89) v1(21.83,17.08) v1(22.68,17.08) v1(22.77,46.8) v1(25.05,17.39) v1(25.41,46.71) v1(25.91,17.39) v1(27.32,32.05) v1(28.3,34.4) v1(33.71,17.08) v1(34.5,17.08) v1(34.7,54.8) v1(35.1,9.29) v1(36.71,51.72) v1(38.85,6.26) v1(39.35,38.05) v1(43.1,54) v1(46.7,55) v1(48.35,25.25) v1(49.7,36.8) v1(52.7,48.8) v1(56.73,54.3) v1(57.7,15.4) v1(59.1,28.8) v1(59.79,42) v1(60.3,36.6) v1(69.3,31.2) v1(71.7,21.4) v1(72.9,24.4)
VBAT: length 56.1
  Top Layer w0.254: U4.6 22.87,41.64 22.5,42 21.7,42 21.3,42.4 21.3,45 21.9,45.6 23.74,45.6 24.1,45.96 24.1,46.67 U4.2
  Bottom Layer w0.254: R9.1 16.8,23.67
  Bottom Layer w0.5: CN5.2 11.85,14.85 12.3,14.4 12.3,11.2 12.9,10.6 21.1,10.6 22.1,9.6 26.5,9.6 27.1,10.2 27.1,14.8 26.1,15.8 19.9,15.8 19.55,16.15 19.55,19.35 16.8,22.1 U8.7
  vias: v1(16.4,24.65) v1(17.23,24.65) v1(23.25,48.4) v1(24.13,48.4) v1(24.9,48.4)
BAT_NTC: length 20.5
  Top Layer w0.254: v1(54.5,33) 53.9,33 52.85,31.95 U14.24 ; CN9.2 55.3,46.5 55.55,46.25 55.55,42.61 v1(55.55,42.6)
  Bottom Layer w0.254: v1(55.55,42.6) 54.35,41.4 54.35,33.15 v1(54.5,33)
BOOT0: length 80.1
  Top Layer w0.254: v1(40.4,30.6) 40,30.6 39.85,30.45 U14.60 35.7,30.45 35.21,30.94 ; v1(68,14.8) 64.25,14.8 62.1,12.65 57.25,12.65 56.9,13 56.9,22.4 56.3,23 54.1,23 v1(53.7,23.4) ; v1(71.45,11.55) 72.3,11.55 72.65,11.2 83.3,11.2 84.1,12 84.1,17 84.8,17.7 C30.1 87.55,17.7 SW5.3 ; 35.21,30.94 R28.2 ; 35.21,30.94 TP21.1
  Bottom Layer w0.254: v1(40.4,30.6) 40.4,26.3 40.92,25.78 45.52,25.78 47.9,23.4 v1(53.7,23.4) ; v1(68,14.8) 69.1,13.7 69.1,11.8 69.35,11.55 v1(71.45,11.55)
DEBUG_RX: length 46.3
  Top Layer w0.254: U9.6 v1(69.3,27.84) ; v1(44.4,35.55) 43.15,35.55 42.65,36.05 U14.43
  Bottom Layer w0.254: v1(44.4,35.55) 44.4,32.7 42.9,31.2 42.9,28.8 43.9,27.8 49.1,27.8 49.3,27.6 49.3,26 49.9,25.4 54.35,25.4 56.15,27.2 63.9,27.2 64.54,27.84 v1(69.3,27.84)
DEBUG_TX: length 50.4
  Top Layer w0.254: U9.7 v1(69.3,26.57) ; U14.42 43.15,39.35 42.92,39.58 v1(42.92,40.1)
  Bottom Layer w0.254: v1(69.3,26.57) v1(65.5,26.57) 63.14,26.57 62.9,26.8 56.4,26.8 54.6,25 49.5,25 48.9,25.6 48.9,27.2 48.7,27.4 43.5,27.4 42.35,28.55 42.35,31.45 43.9,33 43.9,34.6 42.92,35.59 v1(42.92,40.1)
EXADDA: length 70.8
  Top Layer w0.254: v1(35.32,52.2) 36.02,52.9 43.2,52.9 43.5,52.6 43.5,51.4 43.95,50.95 46.15,50.95 46.9,50.2 62.7,50.2 63.1,49.8 v1(63.1,40.4) ; U14.20 52.05,29.95 52.25,30.15 v1(62.1,30.15)
  Bottom Layer w0.254: v1(62.1,30.15) 62.1,36 64.9,38.8 64.9,40.2 64.7,40.4 v1(63.1,40.4) ; v1(35.32,52.2) 35.35,52.17 35.35,46.5
GMR_LA: length 84.9
  Top Layer w0.254: v1(49.1,11.6) 49.1,11 49.5,10.6 49.5,6.35 48.6,5.45 46.7,5.45 44.95,3.7 33.25,3.7 29.9,7.05 22.75,7.05 21.4,5.7 13.2,5.7 12.9,6 12.9,9.24 CN2.4 ; v1(36.4,31.15) 36.7,31.45 U14.58
  Bottom Layer w0.254: v1(49.1,11.6) 49.5,12 49.5,14.8 48.5,15.8 38.3,15.8 36.7,17.4 36.7,23.4 38.3,25 38.3,29.2 39.1,30 39.1,30.8 38.7,31.2 36.45,31.2 v1(36.4,31.15)
GMR_LB: length 87.4
  Top Layer w0.254: CN2.3 10.35,5.8 10.95,5.2 21.7,5.2 23.1,6.6 29.7,6.6 33.05,3.25 45.15,3.25 46.9,5 48.9,5 50,6.1 v1(50,11.6) ; v1(40.3,31.6) 39.65,30.95 U14.59
  Bottom Layer w0.254: v1(40.3,31.6) 39.9,31.6 39.5,31.2 39.5,29.8 38.66,28.96 38.66,24.85 37.06,23.25 37.06,17.55 38.25,16.35 48.45,16.35 49.86,14.95 49.86,11.75 v1(50,11.6)
GMR_RA: length 61.3
  Top Layer w0.254: CN3.4 40.1,5.2 40.7,4.6 44.55,4.6 46.3,6.35 48.1,6.35 48.5,6.76 48.5,9.8 47.3,11 v1(47.3,11.6) ; U14.56 v1(40.25,32.45)
  Bottom Layer w0.254: v1(47.3,11.6) 47.3,12.2 47.75,12.65 48.3,12.65 48.55,12.9 48.55,14.15 47.7,15 37.9,15 35.9,17 35.9,23.8 37.5,25.4 37.5,29.4 37.1,29.8 35.85,29.8 35.25,30.4 35.25,32.15 36,32.9 39.8,32.9 v1(40.25,32.45)
GMR_RB: length 59.4
  Top Layer w0.254: CN3.3 37.6,4.95 38.4,4.15 44.75,4.15 46.5,5.9 48.4,5.9 49,6.5 49,10.25 48.21,11.04 v1(48.21,11.6) ; v1(36.4,32.25) 36.4,32.2 36.65,31.95 U14.57
  Bottom Layer w0.254: v1(48.21,11.6) 48.21,12 48.41,12.2 48.8,12.2 49.05,12.45 49.05,14.45 48.1,15.4 38.1,15.4 36.3,17.2 36.3,23.6 37.9,25.2 37.9,29.8 37.5,30.2 36.1,30.2 35.7,30.6 35.7,31.55 v1(36.4,32.25)
I2C1_SCL: length 241.3
  Top Layer w0.254: v1(5.3,16.4) 5.3,18.8 4.7,19.4 4.7,32.2 4.52,32.38 1.72,32.38 1.1,33 1.1,35.2 1.9,36 8.1,36 v1(8.7,35.4) ; v1(29.5,31.8) 33.3,31.8 33.5,31.6 R23.1 33.5,29.51 TP16.1 33.48,29.22 33.9,28.8 35.75,28.8 36.9,29.95 U14.61 ; v1(16.1,32) 16.1,30.32 U2.4 ; v1(63.3,38.6) 63.3,37.8 63.7,37.4 66.3,37.4 67.5,36.2 67.5,31.45 68.1,30.85 68.1,25.6 68.9,24.8 70.7,24.8 73.1,22.4 73.1,20.6 73.67,20.04 74.73,20.04 74.77,19.99 v1(76.95,19.99) ; v1(55.35,36.45) 54.45,36.45 53.45,37.45 53.45,40.15 53.19,40.4 51.8,40.4 v1(51,41.2)
  Bottom Layer w0.254: v1(8.7,35.4) 9.19,35.4 9.49,35.7 13.2,35.7 16.1,32.8 v1(16.1,32) 18.48,32 18.9,31.58 18.9,28.8 19.5,28.2 26.9,28.2 27.9,29.2 27.9,31.2 28.5,31.8 v1(29.5,31.8) ; v1(5.3,16.4) 5.3,15.8 5.7,15.4 5.7,6.66 5.95,6.4 22.5,6.4 23.1,7 28.3,7 31.33,3.97 48.47,3.97 49.45,4.95 49.45,8.99 49.81,9.34 52.04,9.34 53.36,10.66 53.36,18.63 55.79,21.06 55.79,24.79 56.4,25.4 74.7,25.4 75.5,24.6 75.5,21.83 76.95,20.38 v1(76.95,19.99) ; v1(63.3,38.6) 60.1,38.6 57.95,36.45 v1(55.35,36.45) ; CN11.3 48.77,44.13 48.52,43.87 43.77,43.87 43.1,43.2 43.1,42 43.5,41.6 50.6,41.6 v1(51,41.2)
I2C1_SDA: length 222.8
  Top Layer w0.254: U14.62 38.1,29.4 36.95,29.4 36.66,29.11 36.66,29.1 35.95,28.4 32.93,28.4 TP15.1 31.84,30.98 R22.1 v1(29.9,31.05) ; v1(51.9,41.2) 53.65,41.2 53.9,40.95 53.9,38.2 54.65,37.45 v1(55.4,37.45) ; v1(6.3,16.4) 6.3,18.8 5.3,19.8 5.3,32.75 5.05,33 2.03,33 1.7,33.33 1.7,35 2.1,35.4 7.5,35.4 8.3,34.6 9.07,34.6 9.27,34.8 v1(9.7,34.8) ; v1(77,21.3) 74.73,21.3 74.73,21.31 74.73,21.97 74.5,22.2 73.9,22.2 70.8,25.3 69.25,25.3 68.5,26.05 68.5,31.05 67.98,31.57 67.98,36.32 66.5,37.8 64.65,37.8 64.1,38.35 v1(64.1,39.2) ; U2.3 v1(14.74,32)
  Bottom Layer w0.254: v1(64.1,39.2) 59.9,39.2 58.15,37.45 v1(55.4,37.45) ; v1(51.9,41.2) 52.05,41.35 52.05,46.06 CN11.4 ; v1(6.3,16.4) 6.3,7.06 6.55,6.8 22.3,6.8 22.9,7.4 28.5,7.4 31.48,4.43 48.13,4.43 48.9,5.2 48.9,9.2 49.5,9.8 51.9,9.8 52.9,10.8 52.9,18.8 55.3,21.2 55.3,25 56.1,25.8 75.1,25.8 76.1,24.8 76.1,22.81 77,21.91 v1(77,21.3) ; v1(9.7,34.8) 12.7,34.8 14.74,32.77 v1(14.74,32) 15.34,31.4 18.05,31.4 18.5,30.95 18.5,28.6 19.3,27.8 27.3,27.8 28.5,29 28.5,30.8 28.75,31.05 v1(29.9,31.05)
ICM_CS: length 38.2
  Top Layer w0.254: v1(43.65,29.7) U14.8
  Bottom Layer w0.254: FPC1.7 54.65,49.95 54.15,49.45 54.15,46.05 52.6,44.5 52.6,33.2 51.6,32.2 44.7,32.2 43.65,31.15 v1(43.65,29.7)
ICM_INT: length 27.9
  Top Layer w0.254: v1(44.72,42.21) 44.72,38.02 U14.39
  Bottom Layer w0.254: v1(44.72,42.21) 49.71,42.21 50.25,42.75 50.25,49.55 50.7,50 53.9,50 54.85,50.95 FPC1.9
IMU_MISO: length 36.2
  Top Layer w0.254: U14.10 44.72,26.52 44.72,28.37 45.3,28.95 v1(45.3,29.7)
  Bottom Layer w0.254: v1(45.3,29.7) 45.3,31.2 45.55,31.45 52.05,31.45 52.05,31.45 52.1,31.45 53.5,32.85 53.5,44.1 55.05,45.65 55.05,48.7 55.3,48.95 FPC1.5
IMU_MOSI: length 35.2
  Top Layer w0.254: U14.11 45.15,28.05 46.15,29.05 v1(46.15,29.7)
  Bottom Layer w0.254: FPC1.4 55.75,48.45 55.5,48.2 55.5,45 55.3,44.8 54.7,44.8 54.1,44.2 54.1,43.4 53.9,43.2 53.9,32.55 52.35,31 46.5,31 46.15,30.65 v1(46.15,29.7)
IMU_SCK: length 22.3
  Top Layer w0.254: U14.34 47.15,40.15 47.4,40.4 49.05,40.4 49.38,40.73 49.38,42.88 49.7,43.2 54.1,43.2 v1(54.8,43.9)
  Bottom Layer w0.254: v1(54.8,43.9) 55.55,43.9 55.95,44.3 55.95,47.7 56.2,47.95 FPC1.3
KEY1: length 63
  Top Layer w0.254: U14.25 52.75,32.45 54.1,33.8 56.9,33.8 59.5,31.2 65.3,31.2 66.5,30 66.5,17.8 66.9,17.4 69.7,17.4 70.2,16.9 C26.2 70.2,14.5 68.3,12.6 68.3,5.8 67.5,5 56.7,5 56.1,4.4 SW1.3
KEY2: length 56.5
  Top Layer w0.254: U14.26 52.65,32.95 53.9,34.2 57.1,34.2 59.7,31.6 65.5,31.6 66.9,30.2 66.9,20 67.3,19.6 69.7,19.6 70.2,19.1 C27.2 71.3,17.5 71.3,14.6 68.9,12.2 68.9,5.6 67.7,4.4 64.5,4.4 63.8,3.7 SW2.3
KEY3: length 53.9
  Top Layer w0.254: SW3.3 69.5,3.25 69.5,12 71.9,14.4 71.9,19.1 C28.2 70.2,21.5 69.9,21.8 67.7,21.8 67.3,22.2 67.3,30.4 65.7,32 59.9,32 57.3,34.6 53.7,34.6 52.55,33.45 U14.27
KEY4_BOOT1: length 62.3
  Top Layer w0.254: U14.28 52.45,33.95 53.5,35 57.5,35 60.1,32.4 65.9,32.4 67.7,30.6 67.7,24.4 68.1,24 69.7,24 70.2,23.5 C29.2 71.5,23 72.5,22 72.5,14.2 70.1,11.8 70.1,3.8 70.7,3.2 78.1,3.2 79.1,2.2 SW4.3
LIGHT: length 82.1
  Top Layer w0.254: U14.35 46.65,36.3 v1(47,35.95) ; TP8.1 27.91,11.35 R18.1 v1(27.9,12.4) ; v1(41.5,29) 41.7,29.2 41.7,32.6 42.1,33 45.9,33 46.5,33.6 v1(46.5,34.2)
  Bottom Layer w0.254: v1(27.9,12.4) 28.3,12 28.3,8.2 31.6,4.9 47.8,4.9 48.5,5.6 48.5,9.4 49.3,10.2 51.7,10.2 52.52,11.02 52.52,19.02 54.15,20.65 54.15,22.65 54.5,23 54.5,23.8 54.1,24.2 53.3,24.2 52.9,23.8 48.3,23.8 45.7,26.4 41.9,26.4 41.5,26.8 v1(41.5,29) ; v1(47,35.95) 47,34.7 v1(46.5,34.2)
LIS3_CS: length 37.3
  Top Layer w0.254: v1(44.45,29.7) 44.45,28.85 44.15,28.55 U14.9
  Bottom Layer w0.254: v1(44.45,29.7) 44.45,31.2 45.05,31.8 51.9,31.8 53.06,32.96 53.06,44.31 54.6,45.85 54.6,49.1 54.95,49.45 FPC1.6
LIS3_DRDY: length 53.7
  Top Layer w0.254: v1(52.9,53.8) 55.9,53.8 v1(56.3,53.4) ; U14.55 36.15,32.95 35.7,33.4 35.1,33.4 33.65,34.85 33.65,39.87 33.5,40.02 v1(33.5,40.6) ; v1(44.5,55.2) 42.5,55.2 40.9,53.6 v1(36.5,53.6)
  Bottom Layer w0.254: v1(33.5,40.6) 33.9,41 33.9,49.6 34.7,50.4 34.7,53.2 35.1,53.6 v1(36.5,53.6) ; v1(56.3,53.4) 56.3,51.6 56.5,51.4 60.71,51.4 FPC1.10 ; v1(52.9,53.8) 45.9,53.8 v1(44.5,55.2)
MCO_32K: length 42.5
  Top Layer w0.254: v1(57.6,52.55) v1(52.85,52.55) ; v1(40.3,43.2) 40.32,43.18 42.52,43.18 42.7,43 42.7,41.6 43.65,40.65 U14.41
  Bottom Layer w0.254: FPC1.8 62.1,50.45 62.3,50.65 62.3,51.8 61.55,52.55 v1(57.6,52.55) ; v1(40.3,43.2) 39.5,44 39.5,49.5 40,50 42.25,50 43.05,50.8 50.15,50.8 50.15,50.81 52.51,50.81 52.85,51.15 v1(52.85,52.55)
ML_PWM1: length 50.6
  Top Layer w0.254: U14.14 46.65,24.65 47.7,23.6 48.5,23.6 48.7,23.4 48.7,21.2 48.1,20.6 48.1,17 47.1,16 38.5,16 37.1,17.4 37.1,22.2 36.1,23.2 30.7,23.2 30.1,22.6 18.1,22.6 17.47,21.97 U6.3
ML_PWM2: length 49.6
  Top Layer w0.254: U14.15 47.15,24.75 47.9,24 48.7,24 49.1,23.6 49.1,21 48.5,20.4 48.5,16.8 47.3,15.6 38.3,15.6 36.7,17.2 36.7,22 35.9,22.8 30.9,22.8 30.3,22.2 19.3,22.2 18.74,21.64 U6.2
MR_PWM1: length 39.4
  Top Layer w0.254: U7.3 29.3,19.81 29.3,21.4 29.7,21.8 30.5,21.8 31.1,22.4 35.7,22.4 36.3,21.8 36.3,17 38.1,15.2 47.5,15.2 48.9,16.6 48.9,20.2 49.5,20.8 49.5,23.8 48.9,24.4 48.1,24.4 47.65,24.85 U14.16
MR_PWM2: length 45.2
  Top Layer w0.254: U7.2 30.54,21.24 31.3,22 35.5,22 35.9,21.6 35.9,16.8 37.9,14.8 47.7,14.8 49.3,16.4 49.3,20 49.9,20.6 49.9,23.2 50.3,23.6 52.9,23.6 53.3,24 53.3,26 53,26.3 51.8,26.3 51.4,26.7 51.4,27.9 50.85,28.45 U14.17
OLED_CS: length 85.7
  Top Layer w0.254: v1(44.45,53.35) 45.35,53.35 46.3,52.4 46.7,52.4 47.65,51.45 63.8,51.45 64.3,50.95 64.3,43.6 64.95,42.95 75.85,42.95 76.3,43.4 77.1,43.4 77.7,42.8 77.7,41.4 77.15,40.85 75.7,40.85 v1(75.25,41.3) ; U14.50 36.8,35.45 36.3,35.95 36.3,36.6 36.7,37 37.5,37 37.9,37.4 v1(37.9,38.6)
  Bottom Layer w0.254: v1(75.25,41.3) 75.75,40.8 80.5,40.8 80.9,40.4 80.9,37.6 81.1,37.4 84.28,37.4 84.53,37.15 U13.7 ; v1(44.45,53.35) 43.9,53.35 41.75,51.2 39.3,51.2 38.3,50.2 38.3,39.6 37.9,39.2 v1(37.9,38.6)
OLED_DC: length 43
  Top Layer w0.254: v1(56.5,32.6) 55.85,31.95 54.05,31.95 53.05,30.95 U14.22
  Bottom Layer w0.254: U13.6 81.88,35.6 81.88,34.43 81.65,34.2 79.55,34.2 79.3,33.95 79.3,32.7 79,32.4 73.3,32.4 70.95,30.05 63.95,30.05 62.8,28.9 61.55,28.9 60.87,29.58 60.87,33.63 60.1,34.4 57.65,34.4 56.9,33.65 56.9,33 v1(56.5,32.6)
OLED_RST: length 53.1
  Top Layer w0.254: U14.33 v1(47.65,30.2) ; v1(80.7,33) 80.7,34.46 U13.5
  Bottom Layer w0.254: v1(47.65,30.2) 53.9,30.2 54.6,30.9 v1(55.3,30.9) 57.2,30.9 57.83,31.53 57.83,33.23 58.15,33.55 59.55,33.55 60,33.1 60,29.1 61.1,28 63.1,28 64.25,29.15 71.9,29.15 72.75,30 74.1,30 75.9,31.8 79.5,31.8 v1(80.7,33)
OLED_SCK: length 36.6
  Top Layer w0.254: U14.21 51.95,30.45 52.06,30.56 53.46,30.56 54.49,31.59 56.82,31.59 57.1,31.87 v1(57.1,32) ; v1(72.5,30.6) 72.5,33.84 U13.3
  Bottom Layer w0.254: v1(57.1,32) 57.36,32.26 57.36,33.53 57.83,34 59.85,34 60.45,33.4 60.45,29.35 61.35,28.45 62.95,28.45 64.1,29.6 71.5,29.6 v1(72.5,30.6)
OLED_SDA: length 37.2
  Top Layer w0.254: v1(55.9,33.2) 55.1,32.4 53.9,32.4 52.95,31.45 U14.23
  Bottom Layer w0.254: v1(55.9,33.2) 57.5,34.8 60.35,34.8 61.28,33.87 61.28,29.82 61.7,29.4 62.7,29.4 63.8,30.5 70.5,30.5 73.1,33.1 76.55,33.1 76.8,33.36 76.8,35.6 U13.4
SBUZZ: length 35.7
  Top Layer w0.254: v1(47.6,29.1) 47.2,29.1 46.85,29.45 46.85,30.45 47.1,30.7 47.1,34.8 46.15,35.75 U14.36 ; v1(52.3,27) 56.9,27 58.21,25.69 58.21,22.6 ; 58.21,22.6 64.5,22.6 64.95,22.16 R24.1 ; 58.21,22.6 TP14.1
  Bottom Layer w0.254: v1(47.6,29.1) 50.6,29.1 50.9,28.8 50.9,27.2 51.1,27 v1(52.3,27)
SERVO: length 185.1
  Top Layer w0.254: v1(63.1,33.2) 62.7,33.6 62.7,36.6 v1(62.1,37.2) ; v1(75.7,34) 77.9,34 79.7,32.2 82.7,32.2 v1(83.4,32.9) ; v1(43.7,36.4) 44.15,36.85 U14.40 ; v1(33.9,21.38) 35.32,21.38 35.5,21.2 35.5,16.6 37.7,14.4 47.5,14.4 49.3,12.6 50.7,12.6 53.3,10 v1(61.1,10) ; v1(54.7,42.8) 54.1,42.2 50.5,42.2 50.2,41.9 v1(50.2,40.5)
  Bottom Layer w0.254: v1(62.1,37.2) 61.5,36.6 61.5,36 60.9,35.4 54.9,35.4 54.71,35.59 54.71,38.01 54.9,38.2 54.9,40.95 56.7,42.75 56.7,43 56.3,43.4 55.3,43.4 v1(54.7,42.8) ; v1(61.1,10) 61.1,6.8 62.3,5.6 67.9,5.6 68.9,6.6 68.9,8.6 70.1,9.8 78.5,9.8 81.9,13.2 86.3,13.2 87.5,14.4 87.5,32.2 86.8,32.9 v1(83.4,32.9) ; v1(33.9,21.38) 33.08,22.2 19.1,22.2 18.3,23 18.3,27.2 17.5,28 13.3,28 12.36,28.94 CN12.3 9.74,28.8 ; v1(75.7,34) 72.7,34 71.1,32.4 63.9,32.4 v1(63.1,33.2) ; v1(50.2,40.5) 49.5,39.8 46.3,39.8 45.5,39 45.5,36.6 45.3,36.4 v1(43.7,36.4)
SPI3_CS: length 17.8
  Top Layer w0.254: U14.54 36.45,33.45 35.9,34 35.3,34 34.1,35.2 34.1,43 34.7,43.6 34.7,46.4 35.16,46.86 CN6.5
SPI3_MISO: length 34.5
  Top Layer w0.254: v1(39.3,37) 39.7,36.6 39.7,34.6 39.55,34.45 U14.52 ; R20.1 47.45,46.55 47.3,46.4 47.3,44 47.1,43.8 42.7,43.8 42.3,44.2 42.3,46.59 42.03,46.86 CN6.3 41.05,44.35 40.7,44 39.3,44 38.3,43 36.02,43 35.5,42.48 35.5,37.74 v1(35.86,37.38)
  Bottom Layer w0.254: v1(35.86,37.38) 36.24,37 v1(39.3,37)
SPI3_MOSI: length 28
  Top Layer w0.254: U14.53 36.55,33.95 36.1,34.4 35.7,34.4 34.55,35.55 34.55,42.79 35.96,44.2 36.9,44.2 37.3,44.6 37.3,49.2 37.7,49.6 42.3,49.6 43.55,48.35 CN6.2
SPI3_SCK: length 17.2
  Top Layer w0.254: U14.51 36.8,34.95 36.55,35.2 35.65,35.2 35.06,35.8 35.06,42.69 35.96,43.6 38.1,43.6 38.55,44.05 CN6.4
SWCLK: length 68.6
  Top Layer w0.254: v1(44.45,52.5) 45.55,52.5 46.01,52.05 46.41,52.05 47.4,51.05 63.55,51.05 63.9,50.7 63.9,43.4 64.8,42.5 v1(76.65,42.5) ; U14.49 38.23,35.95 38.48,36.2 38.48,37.55 38.7,37.76 v1(38.7,38.6)
  Bottom Layer w0.254: v1(76.65,42.5) 81.33,42.5 H3.3 ; v1(44.45,52.5) 43.65,52.5 41.95,50.8 39.5,50.8 38.7,50 v1(38.7,38.6)
SWDIO: length 65.7
  Top Layer w0.254: U14.46 41.15,40.8 40.35,41.6 v1(40.3,41.6) ; v1(44.45,51.65) 45.65,51.65 45.9,51.4 46.45,51.4 47.25,50.6 63.25,50.6 63.5,50.35 63.5,43.2 64.65,42.05 75.5,42.05 76,41.55 v1(76.65,41.55)
  Bottom Layer w0.254: H3.2 76.67,41.53 v1(76.65,41.55) ; v1(40.3,41.6) 40.25,41.6 39.1,42.75 39.1,49.75 39.74,50.4 42.09,50.4 43.35,51.65 v1(44.45,51.65)
TC_DN: length 9.8
  Top Layer w0.254: U9.2 82.54,26.57 82.9,26.2 84.58,26.2 USB1.5 84.68,26.2 86.5,26.2 86.7,26.4 86.7,27 86.45,27.25 USB1.7
TC_DP: length 9
  Top Layer w0.254: v1(81.9,27.8) 81.95,27.75 83.38,27.75 ; USB1.6 83.75,26.75 83.38,27.12 83.38,27.75 ; 83.38,27.75 USB1.8 ; U9.1 81.6,25.3 v1(81.9,25.6)
  Bottom Layer w0.254: v1(81.9,25.6) v1(81.9,27.8)
TOP_RX: length 66.8
  Top Layer w0.254: 10.49,18.19 12.3,20 12.3,21.6 13.7,23 29.5,23 v1(30.9,24.4) ; 10.49,18.19 CN7.4 ; 10.49,18.19 10.71,18.19 11.08,17.82 11.08,15.58 10.9,15.4 9.7,15.4 9.35,15.05 R21.1 ; TP10.1 45.15,41.49 U14.38 45.15,35.05 44.55,34.45 40.9,34.45 v1(40.45,34.9)
  Bottom Layer w0.254: v1(30.9,24.4) 31.5,24.4 31.9,24.8 35.7,24.8 36.7,25.8 36.7,28.65 36.41,28.94 35.46,28.94 34.25,30.15 34.25,33.4 35.75,34.9 v1(40.45,34.9)
TOP_TX: length 61.2
  Top Layer w0.254: TP11.1 47.88,42.7 47.88,41.98 47.7,41.8 46.3,41.8 45.65,41.15 U14.37 45.65,34.25 45.35,33.95 v1(40.45,33.95) ; CN7.3 10.83,20.73 13.5,23.4 29,23.4 v1(30.05,24.45)
  Bottom Layer w0.254: 40.2,34 35.95,34 34.75,32.8 34.75,30.3 35.7,29.35 36.8,29.35 37.1,29.05 37.1,25.6 35.9,24.4 32.1,24.4 31.5,23.8 30.28,23.8 30.1,23.98 30.1,24.4 v1(30.05,24.45)
UART3_RX: length 17.4
  Top Layer w0.254: U14.30 52.25,34.95 53.1,35.8 56.05,35.8 56.5,36.25 56.5,38.15 54.95,38.15 54.4,38.7 54.4,40.9 54.9,41.4 55.85,41.4 55.9,41.35 57.7,41.35 57.73,41.38
UART3_TX: length 14.2
  Top Layer w0.254: 57.7,38 57.9,38.2 ; 57.7,38 57.5,37.8 57.5,36.2 56.7,35.4 53.25,35.4 52.3,34.45 U14.29 ; 57.7,38 TP5.1 56.95,38.6 56.95,40.13 57.73,40.13 ; 57.7,38 57.9,38
USB_DN: length 60
  Top Layer w0.254: v1(16.8,52.4) 16.8,51.9 16.95,51.75 USB2.7 ; USB2.5 18.02,49.9 18.02,51.57 18.3,51.85 v1(18.3,52.4) 19.1,53.2 v1(19.1,54.2) ; v1(28.3,53) 28.3,55 27.9,55.4 23.5,55.4 22.7,54.6 22.7,53.4 v1(22.3,53) ; v1(30.5,50.8) 33.3,50.8 34.3,49.8 v1(36.1,49.8) ; U14.44 42.15,35.85 v1(41.5,35.2)
  Bottom Layer w0.254: v1(16.8,52.4) v1(18.3,52.4) ; v1(41.5,35.2) 41.1,35.6 35.1,35.6 34.5,36.2 34.5,39.4 35.1,40 37.1,40 37.5,40.4 37.5,49.4 37.1,49.8 v1(36.1,49.8) ; v1(28.3,53) 28.3,51.8 28.5,51.6 29.7,51.6 v1(30.5,50.8) ; v1(22.3,53) 21.1,53 19.9,54.2 v1(19.1,54.2)
USB_DP: length 60.1
  Top Layer w0.254: v1(36.1,50.6) 34.5,50.6 33.7,51.4 28.25,51.4 26.55,49.7 23.6,49.7 22.7,50.6 22.7,51.8 22.5,52 21.1,52 20.5,52.6 20.5,55 v1(20.3,55.2) ; 17.45,52.75 17.45,49.93 ; v1(41.3,36.2) 41.65,36.55 U14.45 ; v1(17.5,54.2) 17.45,54.15 17.45,53.35 ; 17.45,52.8 17.45,53.35 ; 17.45,53.35 16.25,53.35 15.9,53 15.9,51.8 16.45,51.25 USB2.8
  Bottom Layer w0.254: v1(41.3,36.2) 35.5,36.2 35.1,36.6 35.1,39 35.7,39.6 37.5,39.6 37.9,40 37.9,50.2 37.5,50.6 v1(36.1,50.6) ; v1(17.5,54.2) 17.5,54.6 18.1,55.2 v1(20.3,55.2)
USER_LED: length 70.1
  Top Layer w0.254: v1(41.1,33.2) 41.1,29.8 40.65,29.35 U14.2 ; R27.2 TP19.1 v1(70.5,38.2) ; v1(43.55,50.15) 43.85,50.45 45.85,50.45 46.5,49.8 62.5,49.8 62.7,49.6 62.7,42.6 v1(62.1,42)
  Bottom Layer w0.254: v1(62.1,42) 64.5,42 65.5,41 65.5,38.8 66.1,38.2 v1(70.5,38.2) ; v1(41.1,33.2) 41.1,33.6 42.3,34.8 42.3,39.6 41.39,40.52 41.39,43.32 39.9,44.8 39.9,49.3 40.2,49.6 42.45,49.6 43,50.15 v1(43.55,50.15)
VCAP1: length 4.7
  Top Layer w0.254: U14.31 51.9,35.45 52.5,36.05 C31.1
VCAP2: length 4.7
  Top Layer w0.254: U14.47 40.65,40.1 40.25,40.5 C33.1
VM: length 14.7
  Top Layer w0.5: C14.2 v1(24.96,14.21) 24.49,14.21 24.1,14.6 24.1,18.7 C13.2 ; C10.2 12.1,18.5 12.1,14.6 12.49,14.21 v1(13.28,14.21) C11.2
  vias: v1(14.21,14.21) v1(14.3,38.8) v1(14.3,37.9) v1(15.38,38.8) v1(15.38,37.95) v1(25.95,14.21)
XTAL32_IN: length 7.6
  Top Layer w0.254: C36.1 38.9,21.34 arc(38.83,21.7) X1.2 40.41,23.78 arc(40.96,24.61) 41.15,25.58 U14.3
XTAL32_OUT: length 6.8
  Top Layer w0.254: U14.4 41.65,24.25 arc(41.56,23.79) 41.3,23.4 arc(41.21,23.26) 41.18,23.1 X1.1 41.18,20.56 arc(41.1,20.21) C38.1
XTAL_IN: length 8.5
  Top Layer w0.254: C35.2 43.9,20.38 arc(43.87,20.51) CRYSTAL1.3 arc(43.51,20.68) 43.26,20.85 42.89,21.21 arc(42.34,22.03) 42.15,23 U14.5
XTAL_OUT: length 11.8
  Top Layer w0.254: U14.6 42.65,24.69 arc(42.77,24.1) 43.1,23.6 arc(43.32,23.45) 43.58,23.4 44.7,23.4 arc(44.9,23.36) 45.08,23.25 CRYSTAL1.1 46.61,22.32 arc(46.77,22.29) 46.9,22.2 arc(47.2,21.76) 47.3,21.24 47.3,19.68 arc(47.25,19.42) 47.1,19.2 47.1,19.2 arc(46.55,18.83) C37.2
~RST: length 64.3
  Top Layer w0.254: U14.7 43.15,24.55 43.7,24 45.5,24 45.9,23.6 47.1,23.6 v1(48.1,22.6) ; v1(67.2,14.1) 64.2,14.1 62.3,12.2 57.1,12.2 56.5,12.8 56.5,22.2 56.1,22.6 v1(51.78,22.6) ; v1(71.5,10.6) 84.5,10.6 84.8,10.3 C34.1 84.94,9 TP22.1 87.22,7.61 SW6.1
  Bottom Layer w0.254: v1(71.5,10.6) 68.9,10.6 68.3,11.2 68.3,13 v1(67.2,14.1) ; v1(48.1,22.6) v1(51.78,22.6)
$1N1480: length 1.8
  Top Layer w0.254: U4.7 24.14,40.07 C7.2
$1N1481:
  vias: v1(22.7,44.45) v1(22.7,43.28) v1(27.43,42.7) v1(27.43,41.7) v1(28.23,41.7) v1(28.27,42.69)
$1N1482: length 19.1
  Top Layer w0.254: R2.1 v1(30.3,38.4) R4.2 ; v1(20.8,45.65) 21.6,46.45 U4.4
  Bottom Layer w0.254: v1(20.8,45.65) 20.8,39.7 22.1,38.4 v1(30.3,38.4)
$1N1489: length 1.8
  Top Layer w0.254: C6.2 23.05,37.65 R3.1
$1N1491: length 1.5
  Top Layer w0.254: R3.2 21.55,40.84 U4.5
$1N1811: length 12.2
  Top Layer w0.254: U5.7 24.14,29.24 v1(23.9,29) ; R5.1 v1(19.7,34.6) R7.2
  Bottom Layer w0.254: v1(23.9,29) 23.9,30.8 23.3,31.4 20.1,31.4 19.7,31.8 v1(19.7,34.6)
$1N2361:
  vias: v1(30.54,14.65) v1(30.54,13.75) v1(33.66,14.12) v1(34.42,14.12)
$1N2370:
  vias: v1(18.7,14.65) v1(18.7,13.79) v1(21.87,14.12) v1(22.73,14.12)
$1N4428: length 3.1
  Bottom Layer w0.254: 14.07,21.8 14.3,22.03 U8.8
$1N4483: length 8
  Bottom Layer w0.5: R36.1 10.9,46 11.7,45.2 U8.1 U8.2
$1N4878: length 22
  Top Layer w0.3: USB2.2 19.6,50.3 19.1,50.8 19.1,51.1 19.9,51.9 19.9,54.4 19.3,55 15.7,55 14.7,54 14.7,52.2 15.07,51.83 15.07,50.57 14.8,50.3 USB2.11
  Top Layer w0.5: v1(12.65,48.55) 14.8,48.55 USB2.11
  Bottom Layer w0.5: v1(12.65,48.55) 10.98,48.55 10.9,48.63 9.5,48.63
$1N7204: length 14.9
  Top Layer w0.254: v1(11.73,43.82) 11.5,44.05 11.5,45.2 12.2,45.9 U3.4 ; R29.2 v1(19.7,41) R30.1
  Bottom Layer w0.254: v1(11.73,43.82) 11.73,41.77 12.5,41 19.7,41 v1(19.7,41)
$1N8339: length 10.1
  Top Layer w0.254: v1(20.59,46.6) 19.75,46.6 R31.2 ; v1(13.55,47.66) 13.47,47.57 U3.3
  Bottom Layer w0.254: v1(13.55,47.66) 20.14,47.66 20.59,47.21 v1(20.59,46.6)
$1N8450: length 7.7
  Top Layer w0.254: U3.6 13.3,40.75 v1(13.3,39.8) ; R33.2 R32.1 17.85,40.2 v1(17.1,40.2)
  Bottom Layer w0.254: v1(13.3,39.8) 13.7,40.2 v1(17.1,40.2)
$1N11915: length 17
  Top Layer w0.254: v1(19.2,52.4) 19.2,51.9 18.45,51.15 USB2.4 ; R39.2 28.05,48.65 v1(27.9,48.5)
  Bottom Layer w0.254: v1(19.2,52.4) 19.2,48.7 19.7,48.2 21.9,48.2 22.5,47.6 27,47.6 v1(27.9,48.5)
